# Altium schematic sheet indication.SchDoc
size 420 x 297 mm; SheetNumber: 2; SheetTotal: 2; Scale: 1:1; Обозначение документа: АНГМ.436437.001 Э3
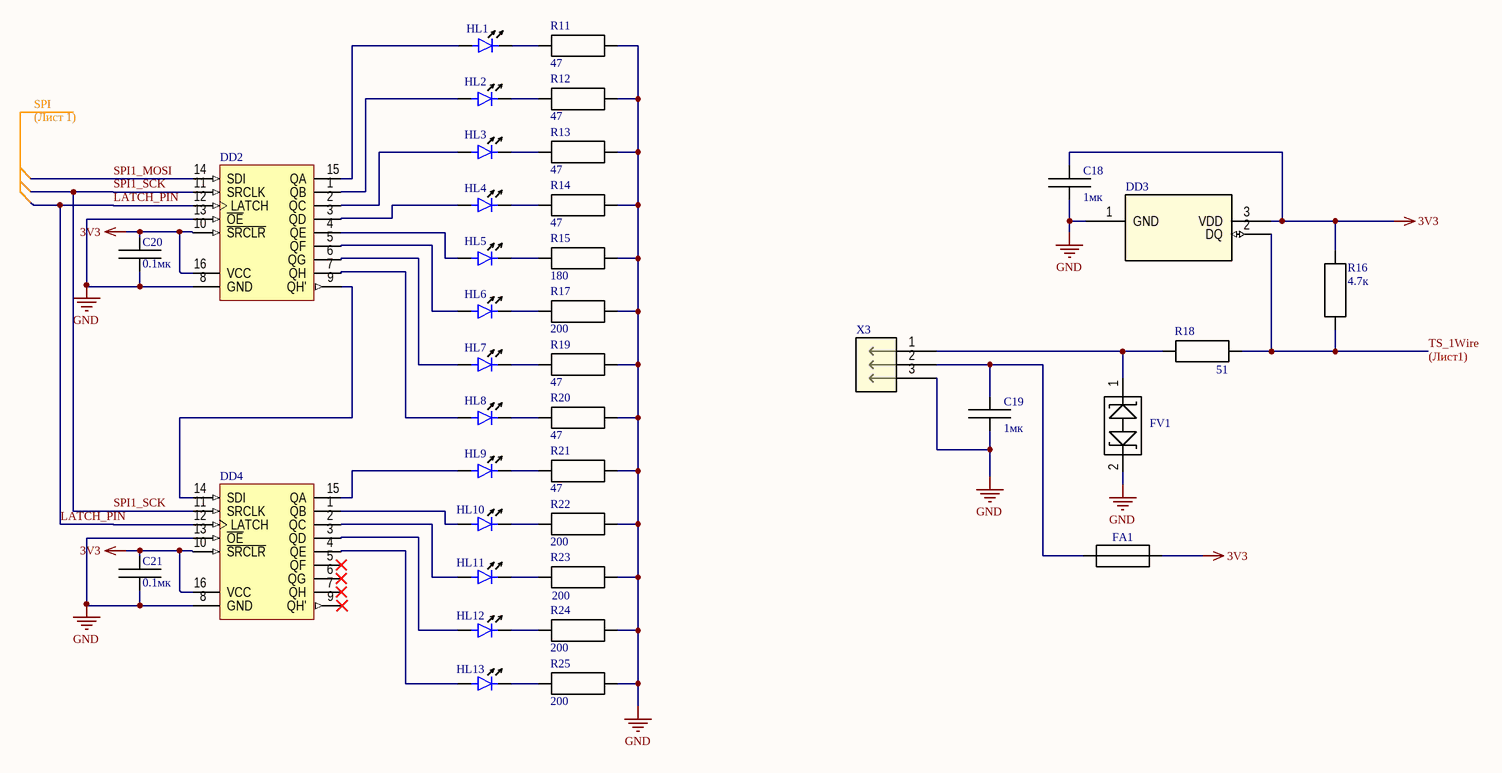
[diagram p0: indication.SchDoc]

## Parts
C18  value 1мк  [RES-0603N]  (hidden comment: GRM188R71H104K Murata)
C19  value 1мк  [RES-0603N]  (hidden comment: GRM188R71H104K Murata)
C20  value 0.1мк  [RES-0603N]  (hidden comment: GRM188R71H104K Murata)
C21  value 0.1мк  [RES-0603N]  (hidden comment: GRM188R71H104K Murata)
DD2  74HC595D Nexperia  [SO-16]  (value not drawn)
DD3  NS18B20-QTOS Novosense  [21-0248A_Q3-1_MXM]  (value not drawn)
DD4  74HC595D Nexperia  [SO-16]  (value not drawn)
FA1  MF-R005-0 Bourns  [FUSE_MF-R050-0-17_BRN]  (value not drawn)
FV1  PESD3V3L1BA Keen Side  [SOD323_NEX]  (value not drawn)
HL1  APTD3216LCGCK Kingbright  [LED-1206N]  (value not drawn)
HL2  APTD3216LCGCK Kingbright  [LED-1206N]  (value not drawn)
HL3  APTD3216LCGCK Kingbright  [LED-1206N]  (value not drawn)
HL4  APTD3216LCGCK Kingbright  [LED-1206N]  (value not drawn)
HL5  APTD3216LSYCK Kingbright  [LED-1206N]  (value not drawn)
HL6  APTD2012LSURCK Kingbright  [LED-0805N]  (value not drawn)
HL7  APTD3216LCGCK Kingbright  [LED-1206N]  (value not drawn)
HL8  APTD3216LCGCK Kingbright  [LED-1206N]  (value not drawn)
HL9  APTD3216LCGCK Kingbright  [LED-1206N]  (value not drawn)
HL10  APTD2012LSURCK Kingbright  [LED-0805N]  (value not drawn)
HL11  APTD2012LSURCK Kingbright  [LED-0805N]  (value not drawn)
HL12  APTD2012LSURCK Kingbright  [LED-0805N]  (value not drawn)
HL13  APTD2012LSURCK Kingbright  [LED-0805N]  (value not drawn)
R11  value 47  [RES-0603N]  (hidden comment: RC0603FR-0747RL Yageo)
R12  value 47  [RES-0603N]  (hidden comment: RC0603FR-0747RL Yageo)
R13  value 47  [RES-0603N]  (hidden comment: RC0603FR-0747RL Yageo)
R14  value 47  [RES-0603N]  (hidden comment: RC0603FR-0747RL Yageo)
R15  value 180  [RES-0603N]  (hidden comment: RC0603FR-07180RL Yageo)
R16  value 4.7к  [RES-0603N]  (hidden comment: RC0603FR-074K7L Yageo)
R17  value 200  [RES-0603N]  (hidden comment: RC0603FR-07200RL Yageo)
R18  value 51  [RES-0603N]  (hidden comment: RC0603FR-0751RL Yageo)
R19  value 47  [RES-0603N]  (hidden comment: RC0603FR-0747RL Yageo)
R20  value 47  [RES-0603N]  (hidden comment: RC0603FR-0747RL Yageo)
R21  value 47  [RES-0603N]  (hidden comment: RC0603FR-0747RL Yageo)
R22  value 200  [RES-0603N]  (hidden comment: RC0603FR-07200RL Yageo)
R23  value 200  [RES-0603N]  (hidden comment: RC0603FR-07200RL Yageo)
R24  value 200  [RES-0603N]  (hidden comment: RC0603FR-07200RL Yageo)
R25  value 200  [RES-0603N]  (hidden comment: RC0603FR-07200RL Yageo)
X3  DS1110-01-3 Connfly  [CONN3_1546551-3_TEC]  (value not drawn)

## Nets
3V3: C18.1 C20.2 C21.2 DD2.10(~{SRCLR}) DD2.16(VCC) DD3.3(VDD) DD4.10(~{SRCLR}) DD4.16(VCC) FA1.2 R16.2
GND: C18.2 C19.2 C20.1 C21.1 DD2.8(GND) DD2.13(~{OE}) DD3.1(GND) DD4.8(GND) DD4.13(~{OE}) FV1.2 R11.2 R12.2 R13.2 R14.2 R15.2 R17.2 R19.2 R20.2 R21.2 R22.2 R23.2 R24.2 R25.2 X3.3
LATCH_PIN: DD2.12(LATCH) DD4.12(LATCH)
SPI1_MOSI: DD2.14(SDI)
SPI1_SCK: DD2.11(SRCLK) DD4.11(SRCLK)
TS_1Wire: DD3.2(DQ) R16.1 R18.2
NetC19_1: C19.1 FA1.1 X3.2
NetDD2_1: DD2.1(QB) HL2.1(Anode)
NetDD2_2: DD2.2(QC) HL3.1(Anode)
NetDD2_3: DD2.3(QD) HL4.1(Anode)
NetDD2_4: DD2.4(QE) HL5.1(Anode)
NetDD2_5: DD2.5(QF) HL6.1(Anode)
NetDD2_6: DD2.6(QG) HL7.1(Anode)
NetDD2_7: DD2.7(QH) HL8.1(Anode)
NetDD2_9: DD2.9(QH') DD4.14(SDI)
NetDD2_15: DD2.15(QA) HL1.1(Anode)
NetDD4_1: DD4.1(QB) HL10.1(Anode)
NetDD4_2: DD4.2(QC) HL11.1(Anode)
NetDD4_3: DD4.3(QD) HL12.1(Anode)
NetDD4_4: DD4.4(QE) HL13.1(Anode)
NetDD4_15: DD4.15(QA) HL9.1(Anode)
NetFV1_1: FV1.1 R18.1 X3.1
NetHL1_2: HL1.2(Cathode) R11.1
NetHL2_2: HL2.2(Cathode) R12.1
NetHL3_2: HL3.2(Cathode) R13.1
NetHL4_2: HL4.2(Cathode) R14.1
NetHL5_2: HL5.2(Cathode) R15.1
NetHL6_2: HL6.2(Cathode) R17.1
NetHL7_2: HL7.2(Cathode) R19.1
NetHL8_2: HL8.2(Cathode) R20.1
NetHL9_2: HL9.2(Cathode) R21.1
NetHL10_2: HL10.2(Cathode) R22.1
NetHL11_2: HL11.2(Cathode) R23.1
NetHL12_2: HL12.2(Cathode) R24.1
NetHL13_2: HL13.2(Cathode) R25.1

Not connected (* = marked no-connect by the designer): DD4 5(QF)* 6(QG)* 7(QH)* 9(QH')*

## Notes on the sheet
- SPI
- (Лист 1)
- (Лист1)
- Подп. и дата
- Инв. № дубл.
- Взам. инв. №
- Инв. № подл.
- Изм.
- Лист
- № докум.
- Подп.
- Дата
- Копировал
- Формат А3

## Library data of the parts
C18 C19 = CAP: Group: Конденсатор; Name: GRM188R61E105KA12D Murata; Причечание: 1 мкФ - 25 В - X5R ±10%
C20 C21 = CAP: Group: Конденсатор; Причечание: 0.1 мкФ - 50 В - X7R ±10%; Name: GRM188R71H104K Murata
DD2 DD4 = 74HC595: 8-Bit Shift Register with 3-State Output Registers; OriginalSource: AltTab; Group: Микросхема; Причечание: 8-битный сдвиговый регистр; Order: *; Name: 74HC595D Nexperia
DD3 = DS18B20+: Programmable Resolution 1-Wire Digital Thermometer; Manufacturer_Name: Analog Devices Inc; Group: Микросхема; Причечание: Высокоточный датчик температуры; Copyright: Copyright (C) 2025 Ultra Librarian. All rights reserved.; Manufacturer_Part_Number: DS18B20+; RefDes: RefDes; Type: Type; Name: NS18B20-QTOS Novosense
FA1 = MF-R050-0-17: Manufacturer_Name: Bourns Electronics; Group: Предохранитель; Причечание: Самовосстанавливающийся 0.05А; Copyright: Copyright (C) 2025 Ultra Librarian. All rights reserved.; Manufacturer_Part_Number: MF-R050-0-17; Name: MF-R005-0 Bourns
FV1 = PESD3V3L1BA: Description; Manufacturer_Name: Nexperia; Group: Диод; Причечание: TVS-диод (защита от ESD) 3.3В; Copyright: Copyright (C) 2025 Ultra Librarian. All rights reserved.; Manufacturer_Part_Number: PESD3V3L1BA; Name: PESD3V3L1BA Keen Side
HL1-HL4 HL7-HL9 = LED: Light Emittering Diode; PartValue: LED*0603 *; OriginalSource: AltTab; Group: Диод; Причечание: Светодиод зеленый; Order: *; Package: *0603; Wavelength: *; LCSC Part #: *; Name: APTD3216LCGCK Kingbright
HL5 = LED: Light Emittering Diode; PartValue: LED*0603 *; OriginalSource: AltTab; Group: Диод; Причечание: Светодиод желтый; Order: *; Package: *0603; Wavelength: *; LCSC Part #: *; Name: APTD3216LSYCK Kingbright
HL6 HL10-HL13 = LED: Light Emittering Diode; PartValue: LED*0603 *; OriginalSource: AltTab; Group: Диод; Причечание: Светодиод красный; Order: *; Package: *0603; Wavelength: *; LCSC Part #: *; Name: APTD2012LSURCK Kingbright
R11-R14 R19-R21 = RES: Group: Резистор; Причечание: 0.1 Вт - 47 Ом ±1%; Name: RC0603FR-0747RL Yageo
R15 = RES: Group: Резистор; Причечание: 0.1 Вт - 180 Ом ±1%; Name: RC0603FR-07180RL Yageo
R16 = RES: Group: Резистор; Причечание: 0.1 Вт - 4.7 кОм ±1%; Name: RC0603FR-074K7L Yageo
R17 R22-R25 = RES: Group: Резистор; Причечание: 0.1 Вт - 200 Ом ±1%; Name: RC0603FR-07200RL Yageo
R18 = RES: Group: Резистор; Причечание: 0.1 Вт - 51 Ом ±1%; Name: RC0603FR-0751RL Yageo
X3 = 1546551-3: 3P,STRAIGHT,SIDE ENTRY,3.5MM; Manufacturer_Name: TE Connectivity; Group: Вилка; Причечание: Разъем миниатюрный 3 pin; Copyright: Copyright (C) 2026 Ultra Librarian. All rights reserved.; Manufacturer_Part_Number: 1546551-3; RefDes: RefDes; Type: Type; Name: DS1110-01-3 Connfly